# Altium schematic sheet Sheet1.SchDoc
size A; SheetNumber: 1; SheetTotal: 3
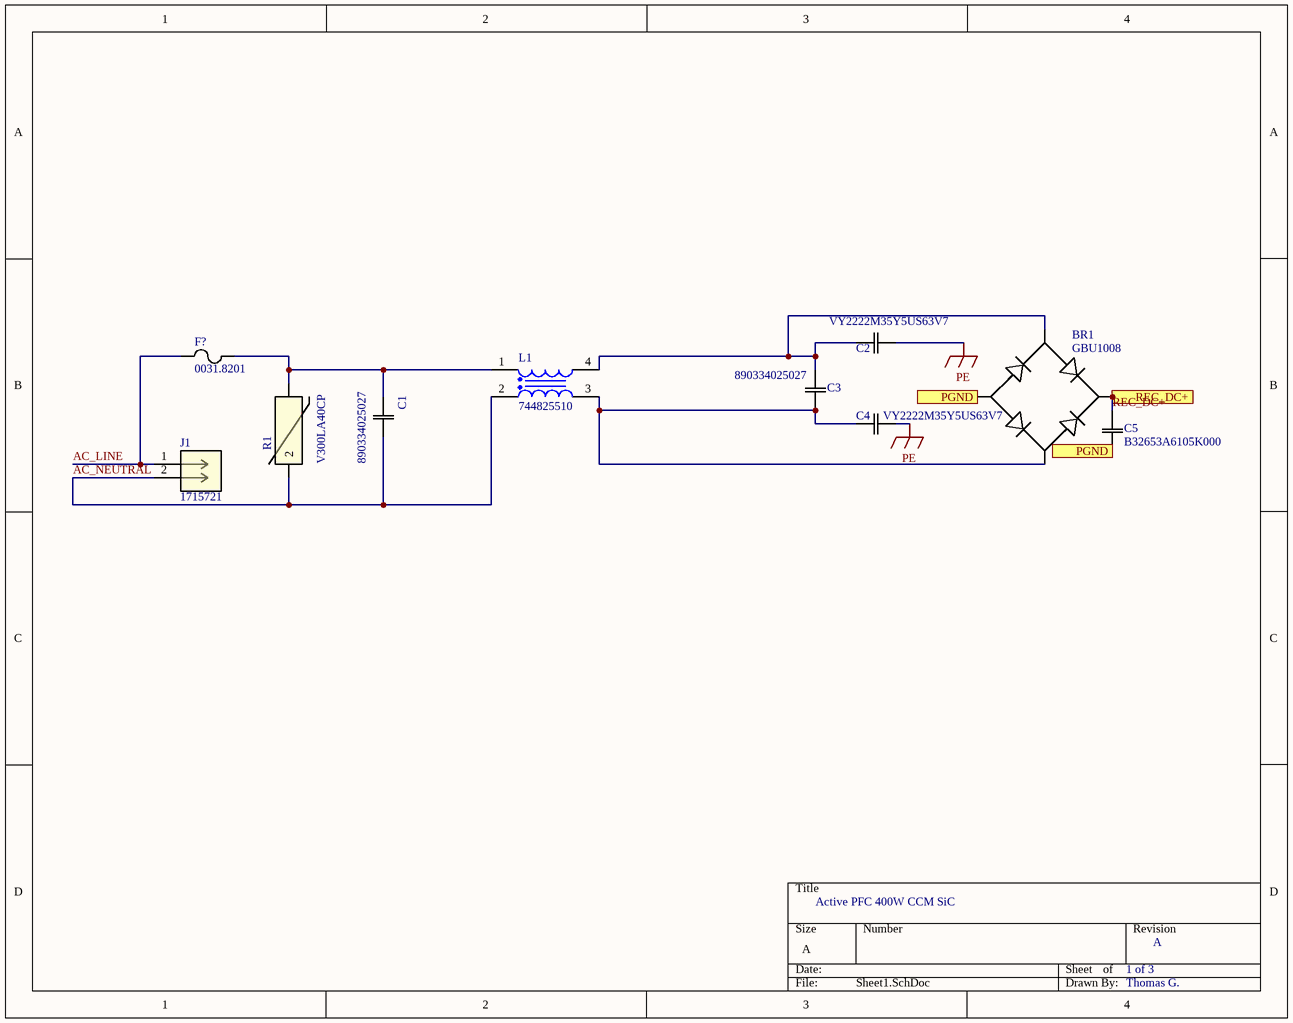
[diagram p0: Sheet1.SchDoc]

## Parts
BR1  GBU1008  [GBU_MTC]
C1  890334025027  [CAP_890334025027_WRE]
C2  VY2222M35Y5US63V7  [CAP_5US63V7_VIS]
C3  890334025027  [CAP_890334025027_WRE]
C4  VY2222M35Y5US63V7  [CAP_5US63V7_VIS]
C5  B32653A6105K000  [CAP_B32653A--22.5--14.5x29.5x26.5_TDK]
F?  0031.8201  [FUSE_0031.8201_SCH]
J1  1715721  [CONN_1715721_PXC]
L1  744825510  [WE-CMB_Type XL_L30W21H35]
R1  V300LA40CP  [MOV_C-III_V-LA-20D_LTF]

## Ports
PGND, REC_DC+

## Nets
PE: C2.2 C4.2
AC_LINE: F?.1 J1.1
AC_NEUTRAL: C1.1 J1.2 L1.2 R1.2
PGND: BR1.4 C5.1 ; port PGND
REC_DC+: BR1.1 C5.2 ; port REC_DC+
NetBR1_2: BR1.2 C2.1 C3.1 L1.4
NetBR1_3: BR1.3 C3.2 C4.1 L1.3
NetC1_2: C1.2 F?.2 L1.1 R1.1

## Notes on the sheet
- Active PFC 400W CCM SiC
- 1 of 3
- A
- Thomas G.

## Library data of the parts
BR1 = GBU1008: Description; Manufacturer_Name: Multicomp; Copyright: Copyright (C) 2026 Ultra Librarian. All rights reserved.; Manufacturer_Part_Number: GBU1008
C1 C3 = 890334025027: WCAP-FTXX X2 Film Capacitors (MKP); Manufacturer_Name: Wurth Electronics; Copyright: Copyright (C) 2026 Ultra Librarian. All rights reserved.; Manufacturer_Part_Number: 890334025027; Datasheet: https://www.we-online.com/catalog/datasheet/890334025027.pdf
C2 C4 = VY2222M35Y5US63V7: VY2 X440Y300VAC 2,2nF Â±20% Y5U BULK e3; Manufacturer_Name: Vishay; Copyright: Copyright (C) 2025 Ultra Librarian. All rights reserved.; Manufacturer_Part_Number: VY2222M35Y5US63V7
C5 = B32653A6105K000: No Description Available; Manufacturer_Name: TDK; Copyright: Copyright (C) 2026 Ultra Librarian. All rights reserved.; Manufacturer_Part_Number: B32653A6105K000
F? = 0031.8201: Description; Manufacturer_Name: Schurter Inc; Copyright: Copyright (C) 2025 Ultra Librarian. All rights reserved.; Manufacturer_Part_Number: 0031.8201
J1 = 1715721: PCB terminal block, nominal current: 17.5 A, rated voltage (III/2): 400 V, nominal cross section: 1.5 mmÂ², number of potentials: 2, number of rows: 1, number of positions per row: 2, product range: MKDS 1,5, pitch: 5.08 mm, connection method: Screw connection with tension sleeve, screw head form: L Slotted, mounting: Wave soldering, conductor/PCB connection direction: 0 Â°, color: green, Pin layout: Linear pinning, Solder pin [P]: 3.5 mm, number of solder pins per potential: 1, type of packaging: packed in cardboard. The article can be aligned to create different nos. of positions!; Manufacturer_Name: Phoenix Contact; Copyright: Copyright (C) 2025 Ultra Librarian. All rights reserved.; Manufacturer_Part_Number: 1715721; RefDes: RefDes; Type: Type
L1 = CMP-0223-00079-2: NexarPartId: 22865138; Resistance: 55mΩ; Inductance Tolerance: 30%; Inductance: 10mH; RoHS: Compliant; Packaging: Bulk; Number of Pins: 4
R1 = V300LA40CP: Description; Manufacturer_Name: Littelfuse Inc; Copyright: Copyright (C) 2025 Ultra Librarian. All rights reserved.; Manufacturer_Part_Number: V300LA40CP